# Altium schematic sheet Battery-Charging-Section.SchDoc
size A4; SheetNumber: 3; SheetTotal: 12
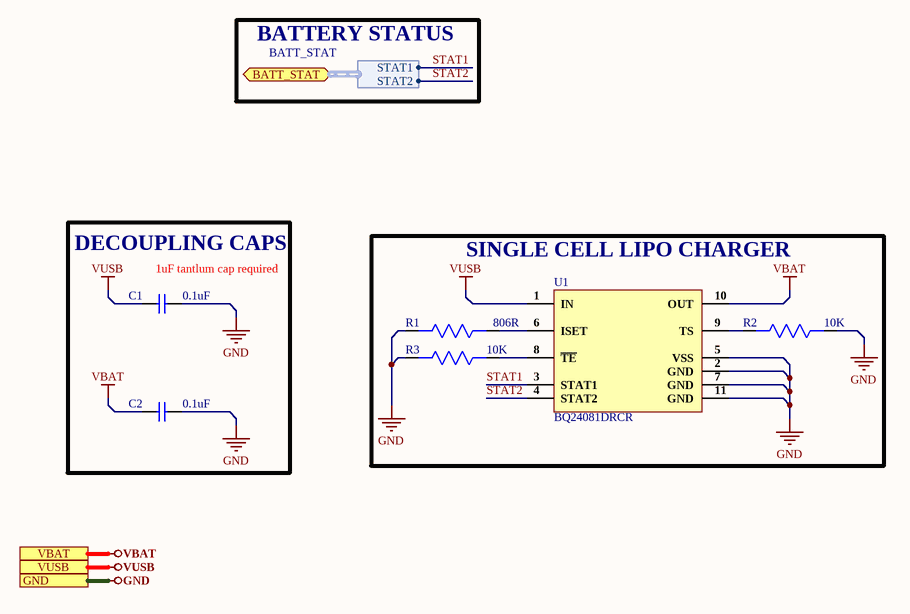
[diagram p0: Battery-Charging-Section.SchDoc]

## Parts
C1  0.1uF  [Cap 0402]
C2  0.1uF  [Cap 0402]
R1  806R  [Res0402]
R2  10K  [Res0402]
R3  10K  [Res0402]
U1  BQ24081DRCR  [10-VSON (3x3)]

## Blocks framed on the sheet
DECOUPLING CAPS: C1 C2
SINGLE CELL LIPO CHARGER: R1-R3 U1

## Ports
BATT_STAT (bidir, harness BATT_STAT), GND, VBAT, VUSB

## Harnesses
BATT_STAT: STAT1, STAT2

## Nets
GND: C1.2 C2.2 R1.2 R2.1 R3.2 U1.2(GND) U1.5(VSS) U1.7(GND) U1.11(GND) ; port GND
VBAT: C2.1 U1.10(OUT) ; port VBAT
VUSB: C1.1 U1.1(IN) ; port VUSB
STAT1: U1.3(STAT1) ; port BATT_STAT.STAT1
STAT2: U1.4(STAT2) ; port BATT_STAT.STAT2
NetR1_1: R1.1 U1.6(ISET)
NetR2_2: R2.2 U1.9(TS)
NetR3_1: R3.1 U1.8(~{TE})

## Notes on the sheet
- BATTERY STATUS
- (near C1) 1uF tantlum cap required
- 1
- Huzaifa Ali

## Library data of the parts
C1 C2 = GRM155R71H104ME14D: CAP CER 0.1UF 50V X7R 0402; Manufacturer: Murata; Tolerance: 20%; Capacitance: 100nF; Supplier 1: Digi-Key; Manufacturer Part Number: GRM155R71H104ME14D; Stock 1: 439844; Pricing 1: 1=0.1, 10=0.038, 100=0.0168, 500=0.01198, 1000=0.00941, 2500=0.00855, 5000=0.00787 (USD); Mount: Surface Mount; Case/Package: 0402; Min Operating Temperature: -55°C; Max Operating Temperature: 125°C; Packaging: Cut Tape; Voltage Rating: 50V; Length: 0.039inch; Width: 0.02inch; Thickness: 0.022inch; ComponentLink1URL: http://search.murata.co.jp/Ceramy/image/img/A01X/G101/ENG/GRM155R71H104ME14-01.pdf?src-supplier=Digi-Key; ComponentLink1Description: http://search.murata.co.jp/Ceramy/image/img/A01X/G101/ENG/GRM155R71H104ME14-01.pdf?src-supplier=Digi-Key; ComponentLink2URL: http://psearch.en.murata.com/capacitor/product/GRM155R71H104ME14%23.pdf?src-supplier=Avnet; ComponentLink2Description: http://psearch.en.murata.com/capacitor/product/GRM155R71H104ME14%23.pdf?src-supplier=Avnet; ComponentLink3URL: http://components.arrow.com/part/dataview/0323_07177683?src-supplier=Arrow+Europe; ComponentLink3Description: http://components.arrow.com/part/dataview/0323_07177683?src-supplier=Arrow+Europe; ComponentLink4URL: http://www.mouser.com/ds/2/281/c02e-2905.pdf?src-supplier=Mouser; ComponentLink4Description: http://www.mouser.com/ds/2/281/c02e-2905.pdf?src-supplier=Mouser; Supplier Part Number 1: 490-10701-1-ND
R1 = AC0402FR-07806RL: RES SMD 806 OHM 1% 1/16W 0402; Manufacturer: Yageo; Max Power Dissipation: 63mW; Temperature Coefficient: 100ppm/°C; Supplier 1: Arrow Electronics; Manufacturer Part Number: AC0402FR-07806RL; RoHS: Yes; Category: Chip SMD Resistors; Stock 1: 6997; Pricing 1: 1=0.04340, 10=0.00890, 25=0.00880, 100=0.00370, 250=0.00360, 1000=0.00210, 3000=0.00140, 6000=0.00110 (USD); Case/Package: 0402; Min Operating Temperature: -55°C; Max Operating Temperature: 155°C; Packaging: Tape and Reel; Resistance: 806R; Resistor Type: Thick Film; Number of Terminations: 2; Tolerance: 1%; Features: Moisture Resistant,Automotive AEC-Q200; Length: 0.039inch; Width: 0.02inch; Height: 0.015inch; RoHS Compliant: Yes; ComponentLink1URL: http://www.yageo.com/NewPortal/yageodocoutput?fileName=/pdf/R-Chip/PYu-AC_51_RoHS_L_6.pdf&src-supplier=Digi-Key; ComponentLink1Description: http://www.yageo.com/NewPortal/yageodocoutput?fileName=/pdf/R-Chip/PYu-AC_51_RoHS_L_6.pdf&src-supplier=Digi-Key; ComponentLink2URL: https://www.yageo.com/upload/media/product/productsearch/datasheet/rchip/PYu-AC_51_RoHS_L_7.pdf?src-supplier=Digi-Key; ComponentLink2Description: https://www.yageo.com/upload/media/product/productsearch/datasheet/rchip/PYu-AC_51_RoHS_L_7.pdf?src-supplier=Digi-Key; Supplier Part Number 1: AC0402FR-07806RL
R2 R3 = RC0402FR-0710KL: RES SMD 10K OHM 1% 1/16W 0402; Manufacturer: Yageo; Resistance: 10kR; Temperature Coefficient: 100ppm/°C; Voltage Rating (DC): 50V; Power Rating: 62.5mW; Supplier 1: Digi-Key; Manufacturer Part Number: RC0402FR-0710KL; Stock 1: 60122563; Pricing 1: 1=0.1, 10=0.016, 100=0.0064, 1000=0.00289, 2500=0.00251, 5000=0.00207 (USD); Case/Package: 0402; Number of Pins: 2; Case Code (Imperial): 0402; Case Code (Metric): 1005; Min Operating Temperature: -55°C; Max Operating Temperature: 155°C; Composition: Thick Film; Tolerance: 1%; Packaging: Tape and Reel; Voltage Rating: 50V; Termination: SMD/SMT; Military Standard: Not; Working Voltage: 50V; Number of Terminations: 2; Length: 1mm; Height: 0.32mm; Width: 0.5mm; Depth: 0.5mm; Lead Pitch: 0.2mm; REACH SVHC: No SVHC; Lead Free: Lead Free; ComponentLink1URL: http://www.farnell.com/datasheets/2167052.pdf?src-supplier=Element14; ComponentLink1Description: http://www.farnell.com/datasheets/2167052.pdf?src-supplier=Element14; ComponentLink2URL: http://www.farnell.com/datasheets/1686128.pdf?src-supplier=Element14; ComponentLink2Description: http://www.farnell.com/datasheets/1686128.pdf?src-supplier=Element14; ComponentLink3URL: http://www.farnell.com/datasheets/1784430.pdf?src-supplier=Element14; ComponentLink3Description: http://www.farnell.com/datasheets/1784430.pdf?src-supplier=Element14; ComponentLink4URL: http://www.yageo.com/documents/recent/PYu-RC_Group_51_RoHS_L_9.pdf?src-supplier=Mouser; ComponentLink4Description: http://www.yageo.com/documents/recent/PYu-RC_Group_51_RoHS_L_9.pdf?src-supplier=Mouser; Supplier Part Number 1: 311-10.0KLRDKR-ND
U1 = BQ24081DRCR: IC BATT CHG LI-ION 1CELL 10VSON; Manufacturer: Texas Instruments; Output Voltage: 4.2V; Min Supply Voltage: 4.5V; Max Supply Voltage: 6.5V; Output Current: 1A; Number of Cells: 1; Supplier 1: Mouser; Manufacturer Part Number: BQ24081DRCR; RoHS: Yes; Category: Battery Management; Pricing 1: 1=1.80000, 10=1.62000, 50=1.53000, 100=1.31000, 1000=0.88800, 10000=0.88700 (USD); Mount: Surface Mount; Case/Package: VSON; Number of Pins: 10; Weight: 0.000921oz; Contact Plating: Gold; Min Operating Temperature: -40°C; Max Operating Temperature: 125°C; Package Quantity: 1; Packaging: Tape and Reel; Series: -; Radiation Hardening: No; Lead Free: Lead Free; RoHS Compliant: Yes; ComponentLink1URL: https://datasheet.ciiva.com/15114/getdatasheetpartid-418523-15114727.pdf?src-supplier=Verical; ComponentLink1Description: https://datasheet.ciiva.com/15114/getdatasheetpartid-418523-15114727.pdf?src-supplier=Verical; ComponentLink2URL: https://datasheet.ciiva.com/1932/bq24081-1932210.pdf?src-supplier=Digi-Key; ComponentLink2Description: https://datasheet.ciiva.com/1932/bq24081-1932210.pdf?src-supplier=Digi-Key; ComponentLink3URL: https://datasheet.ciiva.com/1932/bq24081-1932209.pdf?src-supplier=Digi-Key; ComponentLink3Description: https://datasheet.ciiva.com/1932/bq24081-1932209.pdf?src-supplier=Digi-Key; ComponentLink4URL: https://datasheet.ciiva.com/1932/bq24081-1932211.pdf?src-supplier=Digi-Key; ComponentLink4Description: https://datasheet.ciiva.com/1932/bq24081-1932211.pdf?src-supplier=Digi-Key; ComponentLink5URL: https://datasheet.ciiva.com/3214/bq24080-3214060.pdf?src-supplier=Avnet; ComponentLink5Description: https://datasheet.ciiva.com/3214/bq24080-3214060.pdf?src-supplier=Avnet; Supplier Part Number 1: 595-BQ24081DRCR